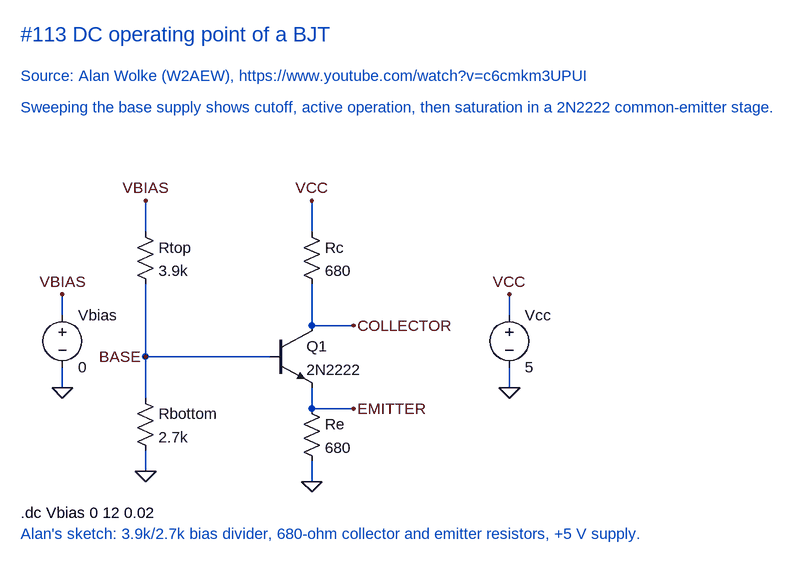
[diagram p0: schematic BJT DC operating regions.asc]
BJT DC operating regions.asc, the LTspice schematic file:
Version 4.1
SHEET 1 1024 960
WIRE 480 336 480 288
WIRE 480 480 480 416
WIRE 544 480 480 480
WIRE 224 336 224 288
WIRE 224 528 224 416
WIRE 416 528 224 528
WIRE 224 592 224 528
WIRE 224 704 224 672
WIRE 480 608 480 576
WIRE 544 608 480 608
WIRE 480 720 480 688
WIRE 96 464 96 432
WIRE 96 576 96 544
WIRE 784 464 784 432
WIRE 784 576 784 544
FLAG 96 432 VBIAS
FLAG 96 576 0
FLAG 224 288 VBIAS
FLAG 224 704 0
FLAG 480 288 VCC
FLAG 480 720 0
FLAG 784 432 VCC
FLAG 784 576 0
FLAG 544 480 COLLECTOR
FLAG 224 528 BASE
FLAG 544 608 EMITTER
SYMBOL voltage 96 448 R0
SYMATTR InstName Vbias
SYMATTR Value 0
SYMBOL voltage 784 448 R0
SYMATTR InstName Vcc
SYMATTR Value 5
SYMBOL res 208 320 R0
SYMATTR InstName Rtop
SYMATTR Value 3.9k
SYMBOL res 208 576 R0
SYMATTR InstName Rbottom
SYMATTR Value 2.7k
SYMBOL res 464 320 R0
SYMATTR InstName Rc
SYMATTR Value 680
SYMBOL npn 416 480 R0
SYMATTR InstName Q1
SYMATTR Value 2N2222
SYMBOL res 464 592 R0
SYMATTR InstName Re
SYMATTR Value 680
TEXT 32 32 Left 3 ;#113 DC operating point of a BJT
TEXT 32 96 Left 2 ;Source: Alan Wolke (W2AEW), https://www.youtube.com/watch?v=c6cmkm3UPUI
TEXT 32 144 Left 2 ;Sweeping the base supply shows cutoff, active operation, then saturation in a 2N2222 common-emitter stage.
TEXT 32 768 Left 2 !.dc Vbias 0 12 0.02
TEXT 32 800 Left 2 ;Alan's sketch: 3.9k/2.7k bias divider, 680-ohm collector and emitter resistors, +5 V supply.

The netlist it stands for:
* BJT DC operating regions.asc
Vbias VBIAS 0 0
Vcc VCC 0 5
Rtop VBIAS BASE 3.9k
Rbottom BASE 0 2.7k
Rc VCC COLLECTOR 680
Q1 COLLECTOR BASE EMITTER 0 2N2222
Re EMITTER 0 680
.model NPN NPN
.model PNP PNP
.lib standard.bjt
* #113 DC operating point of a BJT
* Source: Alan Wolke (W2AEW), https://www.youtube.com/watch?v=c6cmkm3UPUI
* Sweeping the base supply shows cutoff, active operation, then saturation in a 2N2222 common-emitter stage.
.dc Vbias 0 12 0.02
* Alan's sketch: 3.9k/2.7k bias divider, 680-ohm collector and emitter resistors, +5 V supply.
.backanno
.end